# Altium schematic sheet Sheet6.SchDoc
size A3; SheetNumber: 6; SheetTotal: 6
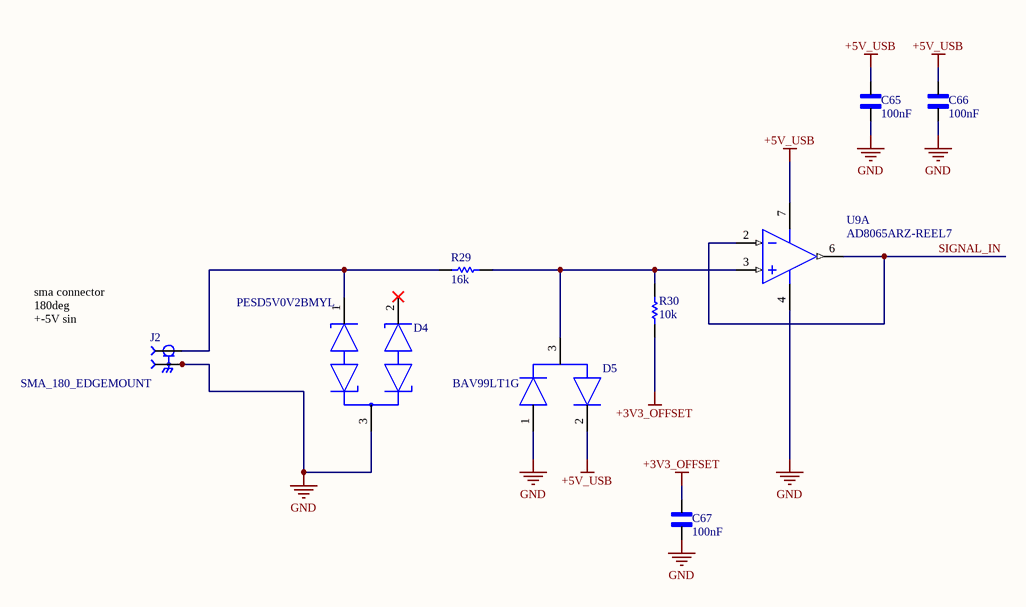
[diagram p0: Sheet6.SchDoc]

## Parts
C65  Parameter 1: 100nF  [0402]  (hidden comment: CC0402JRX7R7BB104)
C66  Parameter 1: 100nF  [0402]  (hidden comment: CC0402JRX7R7BB104)
C67  Parameter 1: 100nF  [0402]  (hidden comment: CC0402JRX7R7BB104)
D4  PESD5V0V2BMYL  [FP-SOT883-MFG]
D5  BAV99LT1G  [FP-318-08-IPC_B]
J2  SMA_180_EDGEMOUNT  [SMA]
R29  16k  [RESC1005X40X20NL05T10]
R30  10k  [RESC1005X40X20NL05T10]
U9  AD8065ARZ-REEL7  [SOIC-8]  (part A of 2)

## Nets
+3V3_OFFSET: C67.2 R30.2
+5V_USB: C65.2 C66.2 D5.2(C) U9.7(+VS)
GND: C65.1 C66.1 C67.1 D4.3(COMMON_CATHODE) D5.1(A) J2.G1 J2.G2 J2.G3 J2.G4 U9.4(-VS)
SIGNAL_IN: U9.2(-IN) U9.6(VOUT)
NetD4_1: D4.1(1_CATHODE) J2.1 R29.2
NetD5_3: D5.3(CATHODE/ANODE) R29.1 R30.1 U9.3(+IN)

Not connected (* = marked no-connect by the designer): D4 2(2_CATHODE)*

## Notes on the sheet
- (near J2) sma connector 180deg
  +-5V sin

## Library data of the parts
C65-C67 = CAP_CER_0402: CAP CER 0.1UF 16V X7R 0402
D4 = CMP-14436-000012-1: TVS DIODE 5V 12.5V DFN1006-3
D5 = CMP-07163-000036-1: DIODE ARRAY 100V 215MA SOT23-3; Capacitance: 1.5pF; Current Rating: 200mA; Max Repetitive Reverse Voltage (Vrrm): 70V; Forward Voltage: 1.25V; Max Forward Surge Current (Ifsm): 500mA; Peak Reverse Current: 2.5uA; Forward Current: 150mA; Peak Non-Repetitive Surge Current: 2A; Reverse Recovery Time: 6ns; Length: 2.9mm; Voltage Rating (DC): 70V; Case/Package: SOT-23; Height: 0.94mm; Number of Pins: 3; Mount: Surface Mount; Min Operating Temperature: -65°C; Lead Free: Lead Free; REACH SVHC: No SVHC; Width: 1.3mm; Packaging: Tape and Reel; Max Operating Temperature: 150°C
R29 R30 = CMP-2002-01682-1: Manufacturer: Vishay BCcomponents; Part Number: TNPW040210K0DEED
U9 = ADI-AD8XX-X8: Single Channel Low Power Operational Amplifier, 145 MHz BW, 180 V/us SR, Industrial, 8-pin SOIC (R-8), Reel; Manufacturer: Analog Devices; Generic Part Number: AD8065; V Span Max: 24V; Input Bias Current: 2pA; V Span Min: 5V; Small Signal Bandwidth: 145MHz; Input Offset Voltage: 400uV; Iq/Amp: 7.4mA; Amplifiers Per Package: 1; Automotive Qualified: Yes; PartNumber: AD8065ARZ-REEL7; ComponentLink1URL: http://www.analog.com/en/index.html; PackageVersion: 060506-A; DatasheetVersion: Rev. J; ComponentLink4URL: http://www.analog.com/en/all-operational-amplifiers-op-amps/operational-amplifiers-op-amps/ad8065/products/product.html#product-recommendations; ComponentLink2URL: http://www.analog.com/static/imported-files/data_sheets/AD8065_8066.pdf; PackageDescription: 8-Pin Standard Small Outline Package, Body 3.9 x 4.9 mm, Pitch 1.27 mm; ComponentLink2Description: Datasheet; ComponentLink1Description: Manufacturer URL; Mounting Technology: Surface Mount; PackageReference: R-8; ComponentLink3Description: Package Specification; Slew Rate: 180V/us; RevisionNote: Reference Circuit URL fixed; ComponentLink4Description: Reference Circuit; Code_JEDEC: MS-012-AA; ComponentLink3URL: http://www.analog.com/static/imported-files/packages/PKG_PDF/SOIC_Narrow%20(R)/R_8.pdf